# Altium project integrating_box_light_source.PrjPcb
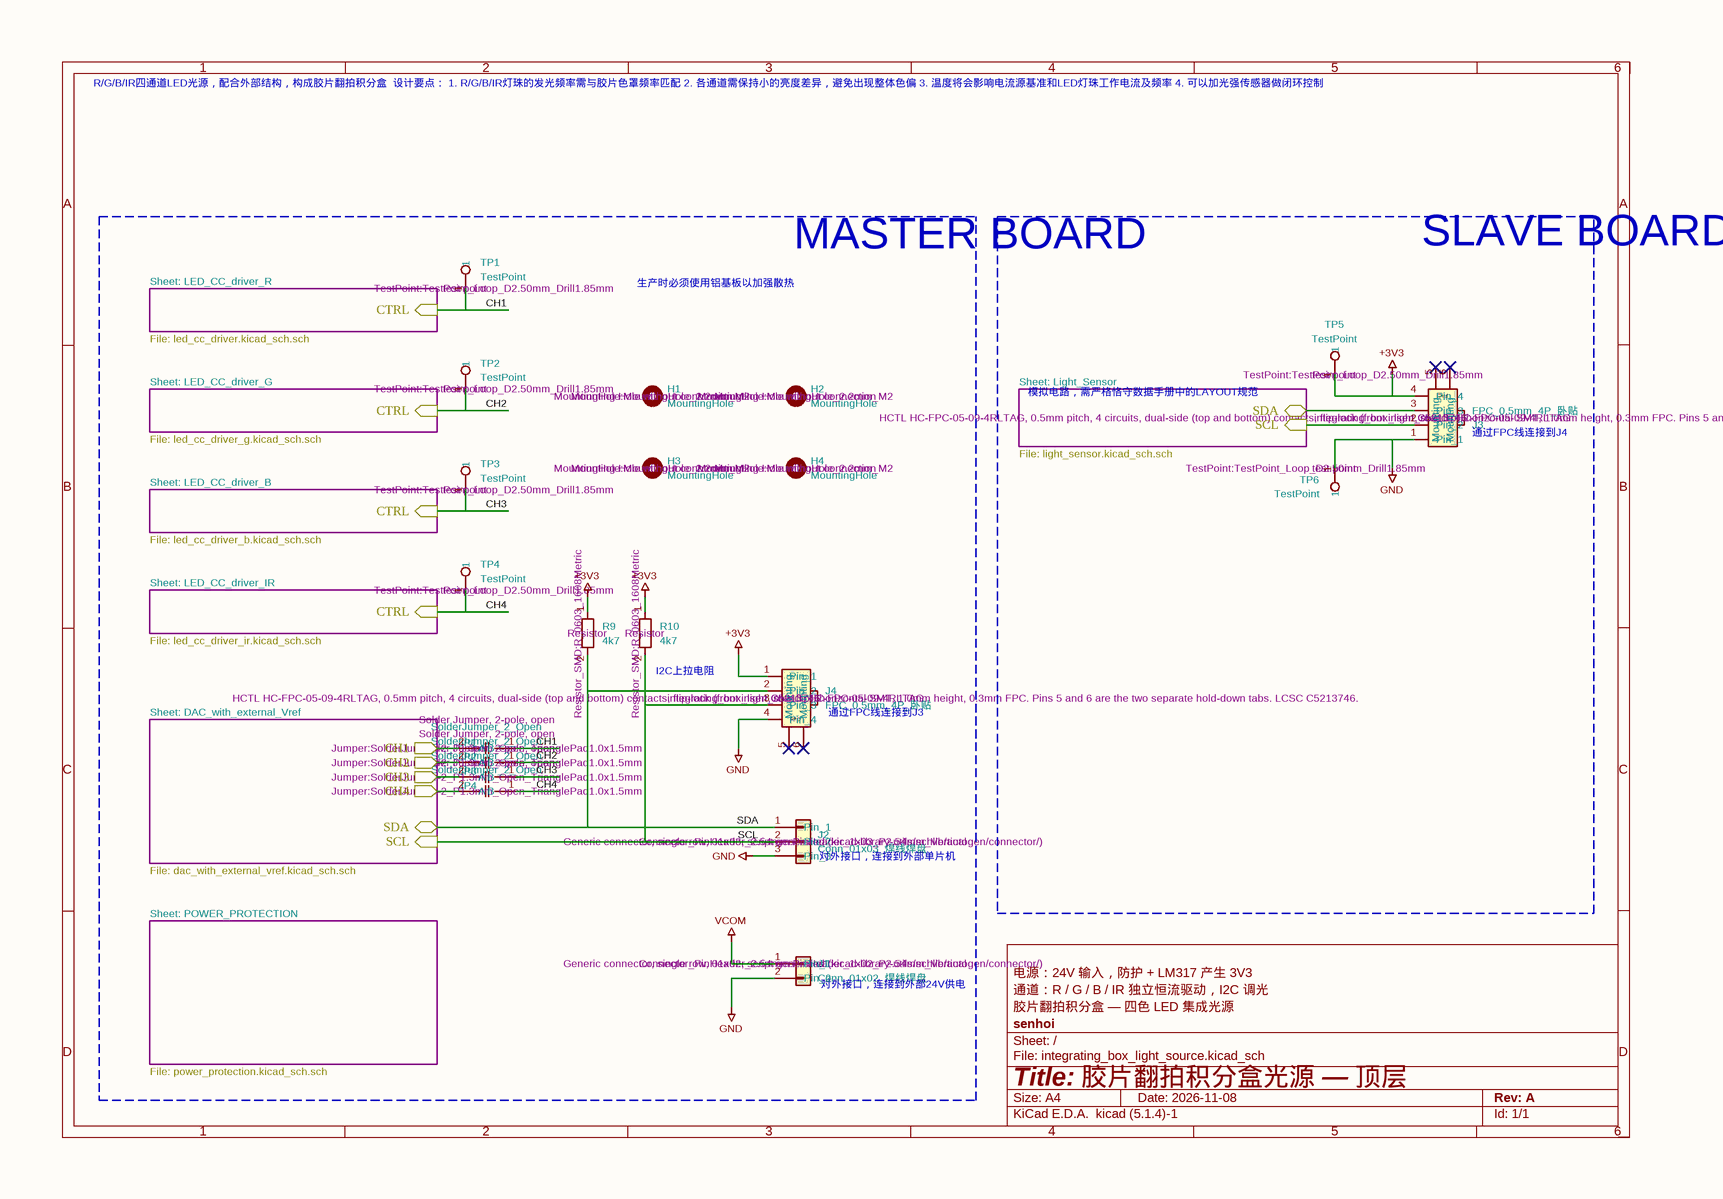
[diagram p0: integrating_box_light_source.SchDoc]
8 sheets, 81 parts. Net scope: hierarchical (ports join the sheet entries above them; power ports are global).
Board file: integrating_box_light_source.PcbDoc
Sheets:
  integrating_box_light_source.SchDoc
    LED_CC_driver_B = led_cc_driver_b.SchDoc
    DAC_with_external_Vref = dac_with_external_vref.SchDoc
    POWER_PROTECTION = power_protection.SchDoc
    Light_Sensor = light_sensor.SchDoc
    LED_CC_driver_G = led_cc_driver_g.SchDoc
    LED_CC_driver_IR = led_cc_driver_ir.SchDoc
    LED_CC_driver_R = led_cc_driver.SchDoc

## Sheet integrating_box_light_source.SchDoc
size 297 x 209 mm

### Parts
H1  Description: Mounting Hole without connection  Footprint: MountingHole:MountingHole_2.2mm_M2  [MountingHole_2.2mm_M2]  (hidden comment: MountingHole)
H2  Description: Mounting Hole without connection  Footprint: MountingHole:MountingHole_2.2mm_M2  [MountingHole_2.2mm_M2]  (hidden comment: MountingHole)
H3  Description: Mounting Hole without connection  Footprint: MountingHole:MountingHole_2.2mm_M2  [MountingHole_2.2mm_M2]  (hidden comment: MountingHole)
H4  Description: Mounting Hole without connection  Footprint: MountingHole:MountingHole_2.2mm_M2  [MountingHole_2.2mm_M2]  (hidden comment: MountingHole)
J1  Description: Generic connector, single row, 01x02, script generated (kicad-library-utils/schlib/autogen/connector/)  Footprint: Connector_PinHeader_2.54mm:PinHeader_1x02_P2.54mm_Vertical  [PinHeader_1x02_P2.54mm_Vertical]  (hidden comment: Conn_01x02_焊线焊盘)
J2  Description: Generic connector, single row, 01x03, script generated (kicad-library-utils/schlib/autogen/connector/)  Footprint: Connector_PinHeader_2.54mm:PinHeader_1x03_P2.54mm_Vertical  [PinHeader_1x03_P2.54mm_Vertical]  (hidden comment: Conn_01x03_焊线焊盘)
J3  Description: HCTL HC-FPC-05-09-4RLTAG, 0.5mm pitch, 4 circuits, dual-side (top and bottom) contacts, flip-lock (front insert, rear flip), horizontal SMT, 1.0mm height, 0.3mm FPC. Pins 5 and 6 are the two separate hold-down tabs. LCSC C5213746.  LCSC: C5213746  Footprint: integrating_box_light_source:HC-FPC-05-09-4RLTAG  [HC-FPC-05-09-4RLTAG]  (hidden comment: FPC_0.5mm_4P_卧贴)
J4  Description: HCTL HC-FPC-05-09-4RLTAG, 0.5mm pitch, 4 circuits, dual-side (top and bottom) contacts, flip-lock (front insert, rear flip), horizontal SMT, 1.0mm height, 0.3mm FPC. Pins 5 and 6 are the two separate hold-down tabs. LCSC C5213746.  LCSC: C5213746  Footprint: integrating_box_light_source:HC-FPC-05-09-4RLTAG  [HC-FPC-05-09-4RLTAG]  (hidden comment: FPC_0.5mm_4P_卧贴)
JP1  Description: Solder Jumper, 2-pole, open  Footprint: Jumper:SolderJumper-2_P1.3mm_Open_TrianglePad1.0x1.5mm  [SolderJumper-2_P1.3mm_Open_TrianglePad1.0x1.5mm]  (hidden comment: SolderJumper_2_Open)
JP2  Description: Solder Jumper, 2-pole, open  Footprint: Jumper:SolderJumper-2_P1.3mm_Open_TrianglePad1.0x1.5mm  [SolderJumper-2_P1.3mm_Open_TrianglePad1.0x1.5mm]  (hidden comment: SolderJumper_2_Open)
JP3  Description: Solder Jumper, 2-pole, open  Footprint: Jumper:SolderJumper-2_P1.3mm_Open_TrianglePad1.0x1.5mm  [SolderJumper-2_P1.3mm_Open_TrianglePad1.0x1.5mm]  (hidden comment: SolderJumper_2_Open)
JP4  Description: Solder Jumper, 2-pole, open  Footprint: Jumper:SolderJumper-2_P1.3mm_Open_TrianglePad1.0x1.5mm  [SolderJumper-2_P1.3mm_Open_TrianglePad1.0x1.5mm]  (hidden comment: SolderJumper_2_Open)
R9  Description: Resistor  Footprint: Resistor_SMD:R_0603_1608Metric  [R_0603_1608Metric]  (hidden comment: 4k7)
R10  Description: Resistor  Footprint: Resistor_SMD:R_0603_1608Metric  [R_0603_1608Metric]  (hidden comment: 4k7)
TP1  Description: test point  Footprint: TestPoint:TestPoint_Loop_D2.50mm_Drill1.85mm  [TestPoint_Loop_D2.50mm_Drill1.85mm]  (hidden comment: TestPoint)
TP2  Description: test point  Footprint: TestPoint:TestPoint_Loop_D2.50mm_Drill1.85mm  [TestPoint_Loop_D2.50mm_Drill1.85mm]  (hidden comment: TestPoint)
TP3  Description: test point  Footprint: TestPoint:TestPoint_Loop_D2.50mm_Drill1.85mm  [TestPoint_Loop_D2.50mm_Drill1.85mm]  (hidden comment: TestPoint)
TP4  Description: test point  Footprint: TestPoint:TestPoint_Loop_D2.50mm_Drill1.85mm  [TestPoint_Loop_D2.50mm_Drill1.85mm]  (hidden comment: TestPoint)
TP5  Description: test point  Footprint: TestPoint:TestPoint_Loop_D2.50mm_Drill1.85mm  [TestPoint_Loop_D2.50mm_Drill1.85mm]  (hidden comment: TestPoint)
TP6  Description: test point  Footprint: TestPoint:TestPoint_Loop_D2.50mm_Drill1.85mm  [TestPoint_Loop_D2.50mm_Drill1.85mm]  (hidden comment: TestPoint)

### Blocks framed on the sheet
MASTER BOARD: H1-H4 J1 J2 J4 JP1-JP4 R9 R10 TP1-TP4
SLAVE BOARD: J3 TP5 TP6

### Sub-sheets
DAC_with_external_Vref = dac_with_external_vref.SchDoc: CH1 (out), CH2 (out), CH3 (out), CH4 (out), SCL (in), SDA (bidir)
LED_CC_driver_B = led_cc_driver_b.SchDoc: CTRL (in)
LED_CC_driver_G = led_cc_driver_g.SchDoc: CTRL (in)
LED_CC_driver_IR = led_cc_driver_ir.SchDoc: CTRL (in)
LED_CC_driver_R = led_cc_driver.SchDoc: CTRL (in)
Light_Sensor = light_sensor.SchDoc: SDA (bidir), SCL (in)
POWER_PROTECTION = power_protection.SchDoc: no entries

### Nets
+3V3: J3.4(Pin_4) J4.1(Pin_1) R9.1 R10.1 TP5.1
GND: J1.2(Pin_2) J2.3(Pin_3) J3.1(Pin_1) J4.4(Pin_4) TP6.1
VCOM: J1.1(Pin_1)
CH1: JP1.1(A) TP1.1 ; sheet LED_CC_driver_R/CTRL
CH1: JP1.2(B) ; sheet DAC_with_external_Vref/CH1  [a separate net that carries the same name]
CH2: JP2.1(A) TP2.1 ; sheet LED_CC_driver_G/CTRL
CH2: JP2.2(B) ; sheet DAC_with_external_Vref/CH2  [a separate net that carries the same name]
CH3: JP3.1(A) TP3.1 ; sheet LED_CC_driver_B/CTRL
CH3: JP3.2(B) ; sheet DAC_with_external_Vref/CH3  [a separate net that carries the same name]
CH4: JP4.1(A) TP4.1 ; sheet LED_CC_driver_IR/CTRL
CH4: JP4.2(B) ; sheet DAC_with_external_Vref/CH4  [a separate net that carries the same name]
SCL: J2.2(Pin_2) J4.3(Pin_3) R10.2 ; sheet DAC_with_external_Vref/SCL
SCL: J3.2(Pin_2) ; sheet Light_Sensor/SCL  [a separate net that carries the same name]
SDA: J2.1(Pin_1) J4.2(Pin_2) R9.2 ; sheet DAC_with_external_Vref/SDA
SDA: J3.3(Pin_3) ; sheet Light_Sensor/SDA  [a separate net that carries the same name]

Not connected (* = marked no-connect by the designer): J3 5(Mounting)* 6(Mounting)*; J4 5(Mounting)* 6(Mounting)*

### Notes on the sheet
- R/G/B/IR四通道LED光源，配合外部结构，构成胶片翻拍积分盒
  设计要点：
  1. R/G/B/IR灯珠的发光频率需与胶片色罩频率匹配
  2. 各通道需保持小的亮度差异，避免出现整体色偏
  3. 温度将会影响电流源基准和LED灯珠工作电流及频率
  4. 可以加光强传感器做闭环控制
- Sheet: LED_CC_driver_R
- 生产时必须使用铝基板以加强散热
- File: led_cc_driver.kicad_sch.sch
- File: led_cc_driver_g.kicad_sch.sch
- Sheet: LED_CC_driver_G
- Sheet: Light_Sensor
- 模拟电路，需严格恪守数据手册中的LAYOUT规范
- Sheet: LED_CC_driver_B
- File: light_sensor.kicad_sch.sch
- (near J3) 通过FPC线连接到J4
- File: led_cc_driver_b.kicad_sch.sch
- File: led_cc_driver_ir.kicad_sch.sch
- Sheet: LED_CC_driver_IR
- Sheet: DAC_with_external_Vref
- (near R10) I2C上拉电阻
- (near J4) 通过FPC线连接到J3
- File: dac_with_external_vref.kicad_sch.sch
- (near J2) 对外接口，连接到外部单片机
- Sheet: POWER_PROTECTION
- (near J1) 对外接口，连接到外部24V供电
- File: power_protection.kicad_sch.sch
- 1
- 2
- 3
- 4
- 5
- 6
- A
- B
- C
- 胶片翻拍积分盒 — 四色 LED 集成光源
- 通道：R / G / B / IR 独立恒流驱动，I2C 调光
- 电源：24V 输入，防护 + LM317 产生 3V3
- D
- Title: 胶片翻拍积分盒光源 — 顶层
- File: integrating_box_light_source.kicad_sch
- Sheet: /
- senhoi
- KiCad E.D.A.  kicad (5.1.4)-1
- Size: A4
- Date: 2026-11-08
- Rev: A
- Id: 1/1
- (in symbol HC-FPC-05-09-4RLTAG) FPC

### Library data of the parts
J1 = Conn_01x02: Value: Conn_01x02_焊线焊盘
J2 = Conn_01x03: Value: Conn_01x03_焊线焊盘
J3 J4 = HC-FPC-05-09-4RLTAG: LCSC Part: C5213746; Value: FPC_0.5mm_4P_卧贴
R9 R10 = R: Value: 4k7
H1-H4 = MountingHole: Value: MountingHole
JP1-JP4 = SolderJumper_2_Open: Value: SolderJumper_2_Open
TP1-TP6 = TestPoint: Value: TestPoint

## Sheet led_cc_driver_b.SchDoc
size 297 x 209 mm
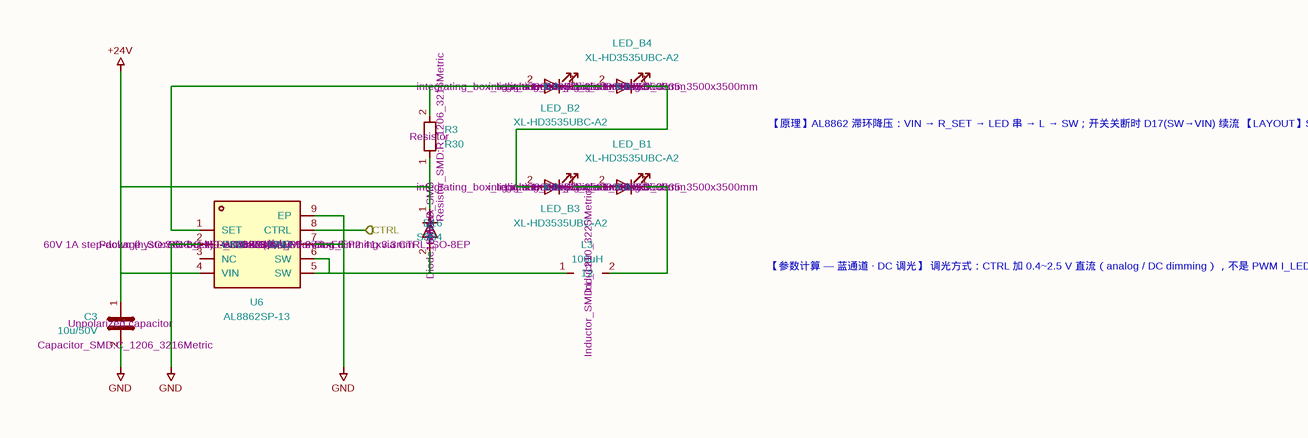
[diagram p1: led_cc_driver_b.SchDoc]

### Parts
C3  Description: Unpolarized capacitor  Footprint: Capacitor_SMD:C_1206_3216Metric  [C_1206_3216Metric]  (hidden comment: 10u/50V)
D16  Description: Diode  Sim.Pins: 1=K 2=A  Footprint: Diode_SMD:D_SMB  [D_SMB]  (hidden comment: SS34)
L3  Description: Inductor  Footprint: Inductor_SMD:L_1210_3225Metric  [L_1210_3225Metric]  (hidden comment: 100uH)
LED_B1  Description: Light emitting diode  Sim.Pins: 1=K 2=A  LCSC Part: C3646953  Footprint: integrating_box_light_source:LED_3535_3500x3500mm  [LED_3535_3500x3500mm]  (hidden comment: XL-HD3535UBC-A2)
LED_B2  Description: Light emitting diode  Sim.Pins: 1=K 2=A  LCSC Part: C3646953  Footprint: integrating_box_light_source:LED_3535_3500x3500mm  [LED_3535_3500x3500mm]  (hidden comment: XL-HD3535UBC-A2)
LED_B3  Description: Light emitting diode  Sim.Pins: 1=K 2=A  LCSC Part: C3646953  Footprint: integrating_box_light_source:LED_3535_3500x3500mm  [LED_3535_3500x3500mm]  (hidden comment: XL-HD3535UBC-A2)
LED_B4  Description: Light emitting diode  Sim.Pins: 1=K 2=A  LCSC Part: C3646953  Footprint: integrating_box_light_source:LED_3535_3500x3500mm  [LED_3535_3500x3500mm]  (hidden comment: XL-HD3535UBC-A2)
R3  Description: Resistor  Footprint: Resistor_SMD:R_1206_3216Metric  [R_1206_3216Metric]  (hidden comment: R30)
U6  Description: 60V 1A step-down (hysteretic buck) LED driver, PWM/analog dimming via CTRL, SO-8EP  LCSC Part: C526360  Manufacturer: DIODES(美台)  Package: SO-8_L4.9-W3.9-P1.27-LS6.0-BL-EP  Footprint: Package_SO:SOIC-8-1EP_3.9x4.9mm_P1.27mm_EP2.41x3.3mm  [SOIC-8-1EP_3.9x4.9mm_P1.27mm_EP2.41x3.3mm]  (hidden comment: AL8862SP-13)

### Ports
CTRL (in)

### Nets
+24V: C3.1 D16.1(K) R3.1 U6.4(VIN)
GND: C3.2 U6.2(GND) U6.7(GND) U6.9(EP)
CH3: U6.8(CTRL) ; port CTRL
NetD16_2: D16.2(A) L3.1 U6.5(SW) U6.6(SW)
NetL3_2: L3.2 LED_B1.1(K)
NetLED_B1_2: LED_B1.2(A) LED_B3.1(K)
NetLED_B2_1: LED_B2.1(K) LED_B4.2(A)
NetLED_B2_2: LED_B2.2(A) R3.2 U6.1(SET)
NetLED_B3_2: LED_B3.2(A) LED_B4.1(K)

Not connected (* = marked no-connect by the designer): U6 3(NC)

### Notes on the sheet
- 【原理】AL8862 滞环降压：VIN → R_SET → LED 串 → L → SW；开关关断时 D17(SW→VIN) 续流
  【LAYOUT】SW→L/D 走线最短以降低 EMI；EP 大面积铺铜 + 散热过孔；R_SET 与 VIN/SET 用 Kelvin 接法
  【焊接】3535 灯珠回流焊 240±5℃/6s，只建议返修时手工焊（<300℃/3s）
- 【参数计算 — 蓝通道 · DC 调光】
  调光方式：CTRL 加 0.4~2.5 V 直流（analog / DC dimming），不是 PWM
  I_LED(100%) = 0.1/0.30 = 333 mA；ΔI = 26 mV/R_SET = 86.6 mA（VSET_HYS = ±13%，固定值）
  V_LED = 4×3.4 V = 13.6 V（蓝光 Vf 最高，留给恒流源余量最小）
  t_OFF = 100µ×86.6m/(13.6+0.5+0.13) = 610 ns
  t_ON = 8.66µ/(24−13.6−0.13) = 845 ns → f_SW = 687 kHz（满载 CCM）
  占空比 D = 13.6/24 = 0.57（四路最高）；母线降到 20 V 仍可调满
  调暗时纹波不降（ΔI 固定）→ 低亮段进 DCM，频率下降
- 1
- 2
- 3
- 4
- 5
- 6
- A
- B
- C
- 通道：蓝光 465nm / 4 颗 3535 串联
- IC：AL8862SP-13 (LCSC C526360)
- 灯珠：XL-HD3535UBC-A2 (LCSC C3646953)
- D
- Title: LED 恒流驱动 — 蓝光通道
- File: led_cc_driver_b.kicad_sch
- Sheet: /
- integrating_box_light_source
- KiCad E.D.A.  kicad (5.1.4)-1
- Size: A4
- Date: 2026-11-08
- Rev: A
- Id: 1/1

### Library data of the parts
C3 = C: Value: 10u/50V
D16 = D: Sim.Device: D; Value: SS34
L3 = L: Value: 100uH
LED_B1-LED_B4 = LED: Value: XL-HD3535UBC-A2
R3 = R: Value: R30
U6 = AL8862SP-13: MPN: AL8862SP-13; Value: AL8862SP-13

## Sheet dac_with_external_vref.SchDoc
size 297 x 209 mm
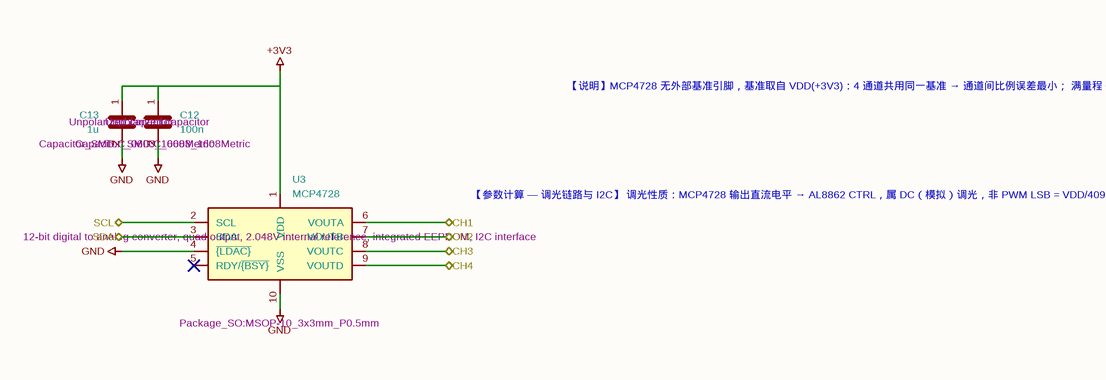
[diagram p2: dac_with_external_vref.SchDoc]

### Parts
C12  Description: Unpolarized capacitor  Footprint: Capacitor_SMD:C_0603_1608Metric  [C_0603_1608Metric]  (hidden comment: 100n)
C13  Description: Unpolarized capacitor  Footprint: Capacitor_SMD:C_0603_1608Metric  [C_0603_1608Metric]  (hidden comment: 1u)
U3  Description: 12-bit digital to analog converter, quad output, 2.048V internal reference, integrated EEPROM, I2C interface  Footprint: Package_SO:MSOP-10_3x3mm_P0.5mm  [MSOP-10_3x3mm_P0.5mm]  (hidden comment: MCP4728)

### Ports
CH1 (bidir), CH2 (bidir), CH3 (bidir), CH4 (bidir), SCL (bidir), SDA (bidir)

### Nets
+3V3: C12.1 C13.1 U3.1(VDD)
GND: C12.2 C13.2 U3.4(~{{LDAC}}) U3.10(VSS)
CH1: U3.6(VOUTA) ; port CH1
CH2: U3.7(VOUTB) ; port CH2
CH3: U3.8(VOUTC) ; port CH3
CH4: U3.9(VOUTD) ; port CH4
SCL: U3.2(SCL) ; port SCL
SDA: U3.3(SDA) ; port SDA

Not connected (* = marked no-connect by the designer): U3 5(RDY/~{{BSY}})*

### Notes on the sheet
- 【说明】MCP4728 无外部基准引脚，基准取自 VDD(+3V3)：4 通道共用同一基准 → 通道间比例误差最小；
  满量程 0~3.3 V，覆盖 AL8862 CTRL 的 0.4~2.5 V 全调光段。（若必须外部基准，可改 DAC7574）
  【LAYOUT】VDD 的 100nF 紧靠引脚 1 并直接回地；I2C 短且远离 SW 节点；四路 VOUT 等长同层，避免与 SW 平行
- 【参数计算 — 调光链路与 I2C】
  调光性质：MCP4728 输出直流电平 → AL8862 CTRL，属 DC（模拟）调光，非 PWM
  LSB = VDD/4096 = 3.3/4096 = 0.806 mV
  CTRL 0.4 V→10%、2.5 V→100% ⇒ 代码 497→3102（2605 级覆盖 10~100%，约 0.035%/级）
  （对照：PWM 调光需 CTRL 在 <0.3 V 与 >2.6 V 间切换，本设计不用）
  I2C 上拉：Rp,max = tr/(0.847·Cb)；400 kHz 时 tr ≤ 300 ns，板内 Cb≈50 pF ⇒ Rp ≤ 7 kΩ
  现用 4k7 → tr = 0.847×4.7k×50p = 199 ns ✔（外接排线 Cb>75 pF 时需降到 3.3k 以下）
- 1
- 2
- 3
- 4
- 5
- 6
- A
- B
- C
- DAC：MCP4728（I2C，4×12 位，LCSC 待选）
- 基准：内部 VDD 基准（MCP4728 无外部基准引脚）
- 输出：CH1~CH4 → AL8862 CTRL 调光
- D
- Title: I2C 四通道 DAC — MCP4728
- File: dac_with_external_vref.kicad_sch
- Sheet: /
- integrating_box_light_source
- KiCad E.D.A.  kicad (5.1.4)-1
- Size: A4
- Date: 2026-11-08
- Rev: A
- Id: 1/1

### Library data of the parts
C12 C13 = C
  C12: Value: 100n
  C13: Value: 1u
U3 = MCP4728: Value: MCP4728

## Sheet power_protection.SchDoc
size 297 x 209 mm
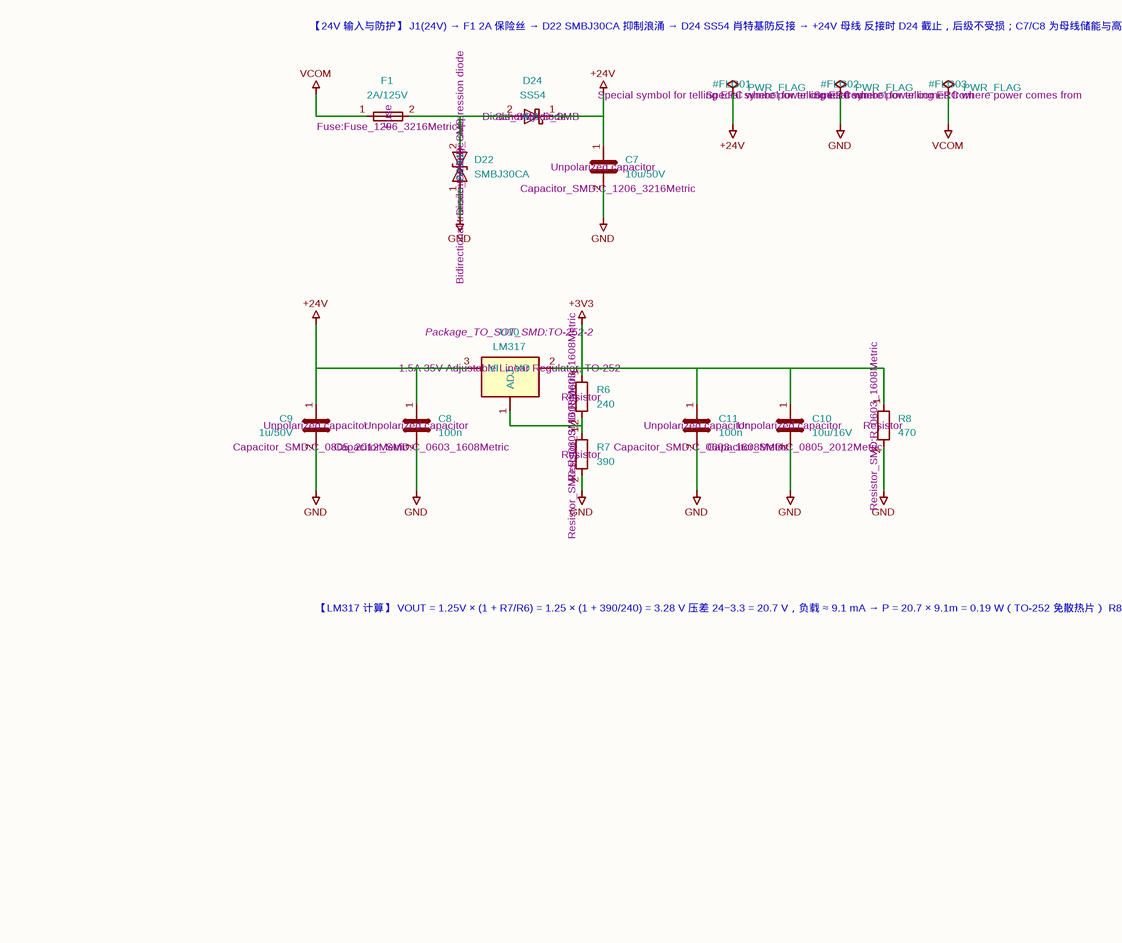
[diagram p3: power_protection.SchDoc]

### Parts
#FLG01  Description: Special symbol for telling ERC where power comes from  (hidden comment: PWR_FLAG)  (graphical)
#FLG02  Description: Special symbol for telling ERC where power comes from  (hidden comment: PWR_FLAG)  (graphical)
#FLG03  Description: Special symbol for telling ERC where power comes from  (hidden comment: PWR_FLAG)  (graphical)
C7  Description: Unpolarized capacitor  Footprint: Capacitor_SMD:C_1206_3216Metric  [C_1206_3216Metric]  (hidden comment: 10u/50V)
C8  Description: Unpolarized capacitor  Footprint: Capacitor_SMD:C_0603_1608Metric  [C_0603_1608Metric]  (hidden comment: 100n)
C9  Description: Unpolarized capacitor  Footprint: Capacitor_SMD:C_0805_2012Metric  [C_0805_2012Metric]  (hidden comment: 1u/50V)
C10  Description: Unpolarized capacitor  Footprint: Capacitor_SMD:C_0805_2012Metric  [C_0805_2012Metric]  (hidden comment: 10u/16V)
C11  Description: Unpolarized capacitor  Footprint: Capacitor_SMD:C_0603_1608Metric  [C_0603_1608Metric]  (hidden comment: 100n)
D22  Description: Bidirectional transient-voltage-suppression diode  Footprint: Diode_SMD:D_SMB  [D_SMB]  (hidden comment: SMBJ30CA)
D24  Description: Schottky diode  Footprint: Diode_SMD:D_SMB  [D_SMB]  (hidden comment: SS54)
F1  Footprint: Fuse:Fuse_1206_3216Metric  [Fuse_1206_3216Metric]  (hidden comment: 2A/125V)
R6  Description: Resistor  Footprint: Resistor_SMD:R_0603_1608Metric  [R_0603_1608Metric]  (hidden comment: 240)
R7  Description: Resistor  Footprint: Resistor_SMD:R_0603_1608Metric  [R_0603_1608Metric]  (hidden comment: 390)
R8  Description: Resistor  Footprint: Resistor_SMD:R_0603_1608Metric  [R_0603_1608Metric]  (hidden comment: 470)
U10  Description: 1.5A 35V Adjustable Linear Regulator, TO-252  Footprint: Package_TO_SOT_SMD:TO-252-2  [TO-252-2]  (hidden comment: LM317)

### Nets
+3V3: C10.1 C11.1 R6.1 R8.1 U10.2(VO)
+24V: #FLG01.1 C7.1 C8.1 C9.1 D24.1(K) U10.3(VI)
GND: #FLG02.1 C7.2 C8.2 C9.2 C10.2 C11.2 D22.1(A1) R7.2 R8.2
VCOM: #FLG03.1 F1.1
NetD22_2: D22.2(A2) D24.2(A) F1.2
NetR6_2: R6.2 R7.1 U10.1(ADJ)

### Notes on the sheet
- 【24V 输入与防护】
  J1(24V) → F1 2A 保险丝 → D22 SMBJ30CA 抑制浪涌 → D24 SS54 肖特基防反接 → +24V 母线
  反接时 D24 截止，后级不受损；C7/C8 为母线储能与高频旁路
  保险丝：4×333 mA = 1.33 A ⇒ 2A；TVS：SMBJ30CA 关断 30 V > 24×1.1 = 26.4 V，峰值钳位 48.4 V
- 【LM317 计算】
  VOUT = 1.25V × (1 + R7/R6) = 1.25 × (1 + 390/240) = 3.28 V
  压差 24−3.3 = 20.7 V，负载 ≈ 9.1 mA → P = 20.7 × 9.1m = 0.19 W（TO-252 免散热片）
  R8 = 470Ω 预负载（7 mA），保证 LM317 轻载稳压；C9 输处、C10/C11 输出
- 1
- 2
- 3
- 4
- 5
- 6
- A
- B
- C
- 输入：24V DC（2A 保险丝 + SMBJ30CA + SS54 防反接）
- 3V3：LM317 线性稳压（模拟电源用线性，避免开关噪声进入 DAC/ADC）
- D
- Title: 电源与防护 — 24V 输入 / 3V3
- File: power_protection.kicad_sch
- Sheet: /
- integrating_box_light_source
- KiCad E.D.A.  kicad (5.1.4)-1
- Size: A4
- Date: 2026-11-08
- Rev: A
- Id: 1/1

### Library data of the parts
C7-C11 = C
  C7: Value: 10u/50V
  C8 C11: Value: 100n
  C9: Value: 1u/50V
  C10: Value: 10u/16V
D22 = D_TVS: Value: SMBJ30CA
D24 = D_Schottky: Value: SS54
F1 = Fuse: Description: Fuse; Value: 2A/125V
R6-R8 = R
  R6: Value: 240
  R7: Value: 390
  R8: Value: 470
U10 = LM317_TO-252: Value: LM317
#FLG01 #FLG02 #FLG03 = PWR_FLAG: Value: PWR_FLAG

## Sheet light_sensor.SchDoc
size 297 x 209 mm
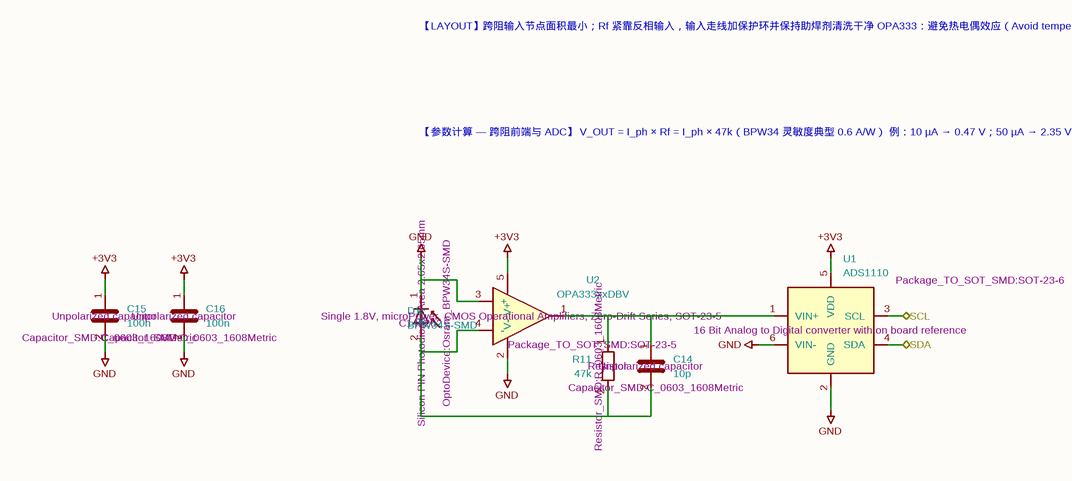
[diagram p4: light_sensor.SchDoc]

### Parts
C14  Description: Unpolarized capacitor  Footprint: Capacitor_SMD:C_0603_1608Metric  [C_0603_1608Metric]  (hidden comment: 10p)
C15  Description: Unpolarized capacitor  Footprint: Capacitor_SMD:C_0603_1608Metric  [C_0603_1608Metric]  (hidden comment: 100n)
C16  Description: Unpolarized capacitor  Footprint: Capacitor_SMD:C_0603_1608Metric  [C_0603_1608Metric]  (hidden comment: 100n)
D1  Description: Silicon PIN Photodiode, Area 2.65x2.65mm  LCSC Part: C145262  Footprint: OptoDevice:Osram_BPW34S-SMD  [Osram_BPW34S-SMD]  (hidden comment: BPW34S-SMD)
R11  Description: Resistor  Footprint: Resistor_SMD:R_0603_1608Metric  [R_0603_1608Metric]  (hidden comment: 47k)
U1  Description: 16 Bit Analog to Digital converter with on board reference  Footprint: Package_TO_SOT_SMD:SOT-23-6  [SOT-23-6]  (hidden comment: ADS1110)
U2  Description: Single 1.8V, microPower, CMOS Operational Amplifiers, Zero-Drift Series, SOT-23-5  Footprint: Package_TO_SOT_SMD:SOT-23-5  [SOT-23-5]  (hidden comment: OPA333xxDBV)

### Ports
SCL (bidir), SDA (bidir)

### Nets
+3V3: C15.1 C16.1 U1.5(VDD) U2.5(V+)
GND: C15.2 C16.2 D1.1(K) U1.2(GND) U1.6(VIN-) U2.2(V-) U2.3(+)
SCL: U1.3(SCL) ; port SCL
SDA: U1.4(SDA) ; port SDA
NetC14_1: C14.1 R11.1 U1.1(VIN+) U2.1
NetC14_2: C14.2 D1.2(A) R11.2 U2.4(-)

### Notes on the sheet
- 【LAYOUT】跨阻输入节点面积最小；Rf 紧靠反相输入，输入走线加保护环并保持助焊剂清洗干净
  OPA333：避免热电偶效应（Avoid temperature gradients that create thermoelectric (Seebeck) effects）
  ——远离热源、避免异种金属结点、防止气流直吹
  ADS1110：差分输入成对走线、远离 SW 节点与电感；VDD 的 100nF 就近回地
- 【参数计算 — 跨阻前端与 ADC】
  V_OUT = I_ph × Rf = I_ph × 47k（BPW34 灵敏度典型 0.6 A/W）
  例：10 µA → 0.47 V；50 µA → 2.35 V（ADS1110 满量程 ±2.048 V @PGA=1）
  带宽 f_p = 1/(2π·Rf·Cf) = 1/(2π×47k×10p) = 339 kHz（Cf 兼作相位补偿）
  噪声：√(4kTRf) = 28 nV/√Hz，折合总噪声 ≈ 20 µV rms（约 0.3 LSB）
  ADC 分辨率：LSB = 4.096/65536 = 62.5 µV ⇒ 电流分辨率 62.5µ/47k = 1.33 nA
- 1
- 2
- 3
- 4
- 5
- 6
- A
- B
- C
- 光电：BPW34（光伏模式）+ OPA333 跨阻
- ADC：ADS1110 16 位差分，内部 2.048V 基准
- 增益：Rf = 47k，Cf = 10p
- D
- Title: 光强检测 — BPW34 跨阻 + ADS1110
- File: light_sensor.kicad_sch
- Sheet: /
- integrating_box_light_source
- KiCad E.D.A.  kicad (5.1.4)-1
- Size: A4
- Date: 2026-11-08
- Rev: A
- Id: 1/1

### Library data of the parts
C14-C16 = C
  C14: Value: 10p
  C15 C16: Value: 100n
D1 = BPW34-SMD: Value: BPW34S-SMD
R11 = R: Value: 47k
U1 = ADS1110: Value: ADS1110
U2 = OPA333xxDBV: Value: OPA333xxDBV

## Sheet led_cc_driver_g.SchDoc
size 297 x 209 mm
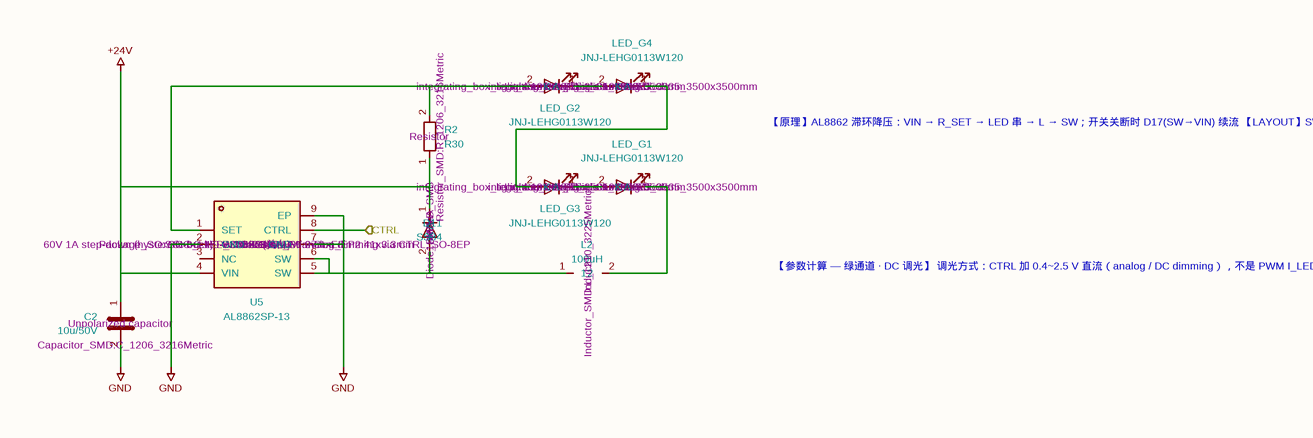
[diagram p5: led_cc_driver_g.SchDoc]

### Parts
C2  Description: Unpolarized capacitor  Footprint: Capacitor_SMD:C_1206_3216Metric  [C_1206_3216Metric]  (hidden comment: 10u/50V)
D11  Description: Diode  Sim.Pins: 1=K 2=A  Footprint: Diode_SMD:D_SMB  [D_SMB]  (hidden comment: SS34)
L2  Description: Inductor  Footprint: Inductor_SMD:L_1210_3225Metric  [L_1210_3225Metric]  (hidden comment: 100uH)
LED_G1  Description: Light emitting diode  Sim.Pins: 1=K 2=A  LCSC Part: C19185875  Footprint: integrating_box_light_source:LED_3535_3500x3500mm  [LED_3535_3500x3500mm]  (hidden comment: JNJ-LEHG0113W120)
LED_G2  Description: Light emitting diode  Sim.Pins: 1=K 2=A  LCSC Part: C19185875  Footprint: integrating_box_light_source:LED_3535_3500x3500mm  [LED_3535_3500x3500mm]  (hidden comment: JNJ-LEHG0113W120)
LED_G3  Description: Light emitting diode  Sim.Pins: 1=K 2=A  LCSC Part: C19185875  Footprint: integrating_box_light_source:LED_3535_3500x3500mm  [LED_3535_3500x3500mm]  (hidden comment: JNJ-LEHG0113W120)
LED_G4  Description: Light emitting diode  Sim.Pins: 1=K 2=A  LCSC Part: C19185875  Footprint: integrating_box_light_source:LED_3535_3500x3500mm  [LED_3535_3500x3500mm]  (hidden comment: JNJ-LEHG0113W120)
R2  Description: Resistor  Footprint: Resistor_SMD:R_1206_3216Metric  [R_1206_3216Metric]  (hidden comment: R30)
U5  Description: 60V 1A step-down (hysteretic buck) LED driver, PWM/analog dimming via CTRL, SO-8EP  LCSC Part: C526360  Manufacturer: DIODES(美台)  Package: SO-8_L4.9-W3.9-P1.27-LS6.0-BL-EP  Footprint: Package_SO:SOIC-8-1EP_3.9x4.9mm_P1.27mm_EP2.41x3.3mm  [SOIC-8-1EP_3.9x4.9mm_P1.27mm_EP2.41x3.3mm]  (hidden comment: AL8862SP-13)

### Ports
CTRL (in)

### Nets
+24V: C2.1 D11.1(K) R2.1 U5.4(VIN)
GND: C2.2 U5.2(GND) U5.7(GND) U5.9(EP)
CH2: U5.8(CTRL) ; port CTRL
NetD11_2: D11.2(A) L2.1 U5.5(SW) U5.6(SW)
NetL2_2: L2.2 LED_G1.1(K)
NetLED_G1_2: LED_G1.2(A) LED_G3.1(K)
NetLED_G2_1: LED_G2.1(K) LED_G4.2(A)
NetLED_G2_2: LED_G2.2(A) R2.2 U5.1(SET)
NetLED_G3_2: LED_G3.2(A) LED_G4.1(K)

Not connected (* = marked no-connect by the designer): U5 3(NC)

### Notes on the sheet
- 【原理】AL8862 滞环降压：VIN → R_SET → LED 串 → L → SW；开关关断时 D17(SW→VIN) 续流
  【LAYOUT】SW→L/D 走线最短以降低 EMI；EP 大面积铺铜 + 散热过孔；R_SET 与 VIN/SET 用 Kelvin 接法
  【焊接】3535 灯珠回流焊 240±5℃/6s，只建议返修时手工焊（<300℃/3s）
- 【参数计算 — 绿通道 · DC 调光】
  调光方式：CTRL 加 0.4~2.5 V 直流（analog / DC dimming），不是 PWM
  I_LED(100%) = 0.1/0.30 = 333 mA；ΔI = 26 mV/R_SET = 86.6 mA（VSET_HYS = ±13%，固定值）
  V_LED = 4×3.2 V = 12.8 V（Vf 2.8~3.5 V，取典型 3.2）
  t_OFF = 100µ×86.6m/(12.8+0.5+0.13) = 650 ns
  t_ON = 8.66µ/(24−12.8−0.13) = 783 ns → f_SW = 698 kHz（满载 CCM）
  调暗到 10%：纹波仍 ~86.6 mA > 平均 33 mA → 进 DCM，频率下降（与手册“负载范围内校核 on/off 时间”一致）
  P_R_SET = 0.033 W；单颗灯珠约 1.1 W，焊盘铺铜按 3535 规格书
- 1
- 2
- 3
- 4
- 5
- 6
- A
- B
- C
- 通道：绿光 525nm / 4 颗 3535 串联
- IC：AL8862SP-13 (LCSC C526360)
- 灯珠：JNJ-LEHG0113W120 (LCSC C19185875)
- D
- Title: LED 恒流驱动 — 绿光通道
- File: led_cc_driver_g.kicad_sch
- Sheet: /
- integrating_box_light_source
- KiCad E.D.A.  kicad (5.1.4)-1
- Size: A4
- Date: 2026-11-08
- Rev: A
- Id: 1/1

### Library data of the parts
C2 = C: Value: 10u/50V
D11 = D: Sim.Device: D; Value: SS34
L2 = L: Value: 100uH
LED_G1-LED_G4 = LED: Value: JNJ-LEHG0113W120
R2 = R: Value: R30
U5 = AL8862SP-13: MPN: AL8862SP-13; Value: AL8862SP-13

## Sheet led_cc_driver_ir.SchDoc
size 297 x 209 mm
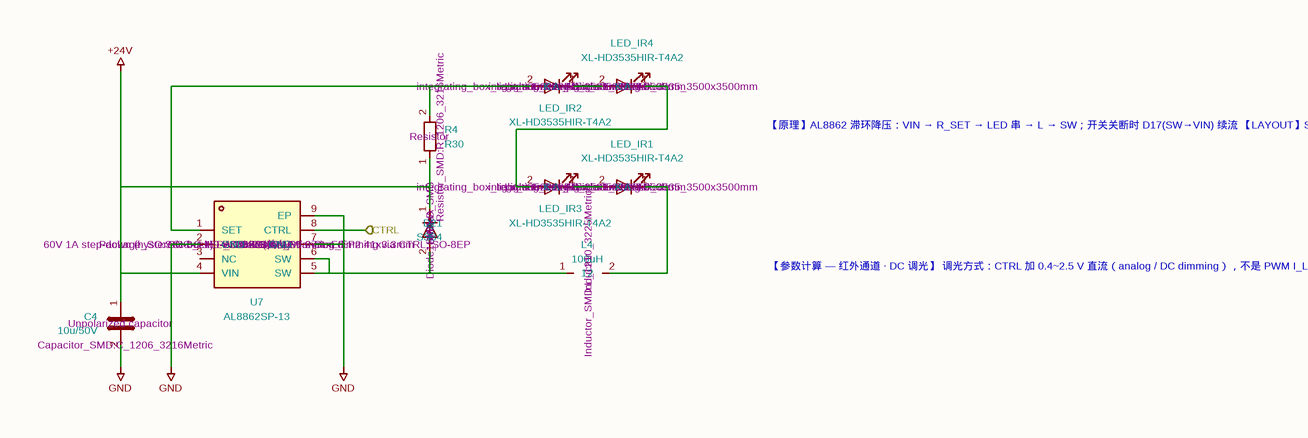
[diagram p6: led_cc_driver_ir.SchDoc]

### Parts
C4  Description: Unpolarized capacitor  Footprint: Capacitor_SMD:C_1206_3216Metric  [C_1206_3216Metric]  (hidden comment: 10u/50V)
D21  Description: Diode  Sim.Pins: 1=K 2=A  Footprint: Diode_SMD:D_SMB  [D_SMB]  (hidden comment: SS34)
L4  Description: Inductor  Footprint: Inductor_SMD:L_1210_3225Metric  [L_1210_3225Metric]  (hidden comment: 100uH)
LED_IR1  Description: Light emitting diode  Sim.Pins: 1=K 2=A  LCSC Part: C5221244  Footprint: integrating_box_light_source:LED_3535_3500x3500mm  [LED_3535_3500x3500mm]  (hidden comment: XL-HD3535HIR-T4A2)
LED_IR2  Description: Light emitting diode  Sim.Pins: 1=K 2=A  LCSC Part: C5221244  Footprint: integrating_box_light_source:LED_3535_3500x3500mm  [LED_3535_3500x3500mm]  (hidden comment: XL-HD3535HIR-T4A2)
LED_IR3  Description: Light emitting diode  Sim.Pins: 1=K 2=A  LCSC Part: C5221244  Footprint: integrating_box_light_source:LED_3535_3500x3500mm  [LED_3535_3500x3500mm]  (hidden comment: XL-HD3535HIR-T4A2)
LED_IR4  Description: Light emitting diode  Sim.Pins: 1=K 2=A  LCSC Part: C5221244  Footprint: integrating_box_light_source:LED_3535_3500x3500mm  [LED_3535_3500x3500mm]  (hidden comment: XL-HD3535HIR-T4A2)
R4  Description: Resistor  Footprint: Resistor_SMD:R_1206_3216Metric  [R_1206_3216Metric]  (hidden comment: R30)
U7  Description: 60V 1A step-down (hysteretic buck) LED driver, PWM/analog dimming via CTRL, SO-8EP  LCSC Part: C526360  Manufacturer: DIODES(美台)  Package: SO-8_L4.9-W3.9-P1.27-LS6.0-BL-EP  Footprint: Package_SO:SOIC-8-1EP_3.9x4.9mm_P1.27mm_EP2.41x3.3mm  [SOIC-8-1EP_3.9x4.9mm_P1.27mm_EP2.41x3.3mm]  (hidden comment: AL8862SP-13)

### Ports
CTRL (in)

### Nets
+24V: C4.1 D21.1(K) R4.1 U7.4(VIN)
GND: C4.2 U7.2(GND) U7.7(GND) U7.9(EP)
CH4: U7.8(CTRL) ; port CTRL
NetD21_2: D21.2(A) L4.1 U7.5(SW) U7.6(SW)
NetL4_2: L4.2 LED_IR1.1(K)
NetLED_IR1_2: LED_IR1.2(A) LED_IR3.1(K)
NetLED_IR2_1: LED_IR2.1(K) LED_IR4.2(A)
NetLED_IR2_2: LED_IR2.2(A) R4.2 U7.1(SET)
NetLED_IR3_2: LED_IR3.2(A) LED_IR4.1(K)

Not connected (* = marked no-connect by the designer): U7 3(NC)

### Notes on the sheet
- 【原理】AL8862 滞环降压：VIN → R_SET → LED 串 → L → SW；开关关断时 D17(SW→VIN) 续流
  【LAYOUT】SW→L/D 走线最短以降低 EMI；EP 大面积铺铜 + 散热过孔；R_SET 与 VIN/SET 用 Kelvin 接法
  【焊接】3535 灯珠回流焊 240±5℃/6s，只建议返修时手工焊（<300℃/3s）
- 【参数计算 — 红外通道 · DC 调光】
  调光方式：CTRL 加 0.4~2.5 V 直流（analog / DC dimming），不是 PWM
  I_LED(100%) = 0.1/0.30 = 333 mA；ΔI = 26 mV/R_SET = 86.6 mA（VSET_HYS = ±13%，固定值）
  V_LED = 4×1.55 V = 6.2 V
  t_OFF = 100µ×86.6m/(6.2+0.5+0.13) = 1268 ns
  t_ON = 8.66µ/(24−6.2−0.13) = 487 ns → f_SW = 570 kHz（满载 CCM）
  红外灯珠 Vf 温漂较大（约 −3 mV/K）：低温时 V_LED 略升，仍远低于 24 V 母线
- 1
- 2
- 3
- 4
- 5
- 6
- A
- B
- C
- 通道：红外 850nm / 4 颗 3535 串联
- IC：AL8862SP-13 (LCSC C526360)
- 灯珠：XL-HD3535HIR-T4A2 (LCSC C5221244)
- D
- Title: LED 恒流驱动 — 红外通道
- File: led_cc_driver_ir.kicad_sch
- Sheet: /
- integrating_box_light_source
- KiCad E.D.A.  kicad (5.1.4)-1
- Size: A4
- Date: 2026-11-08
- Rev: A
- Id: 1/1

### Library data of the parts
C4 = C: Value: 10u/50V
D21 = D: Sim.Device: D; Value: SS34
L4 = L: Value: 100uH
LED_IR1-LED_IR4 = LED: Value: XL-HD3535HIR-T4A2
R4 = R: Value: R30
U7 = AL8862SP-13: MPN: AL8862SP-13; Value: AL8862SP-13

## Sheet led_cc_driver.SchDoc
size 297 x 209 mm
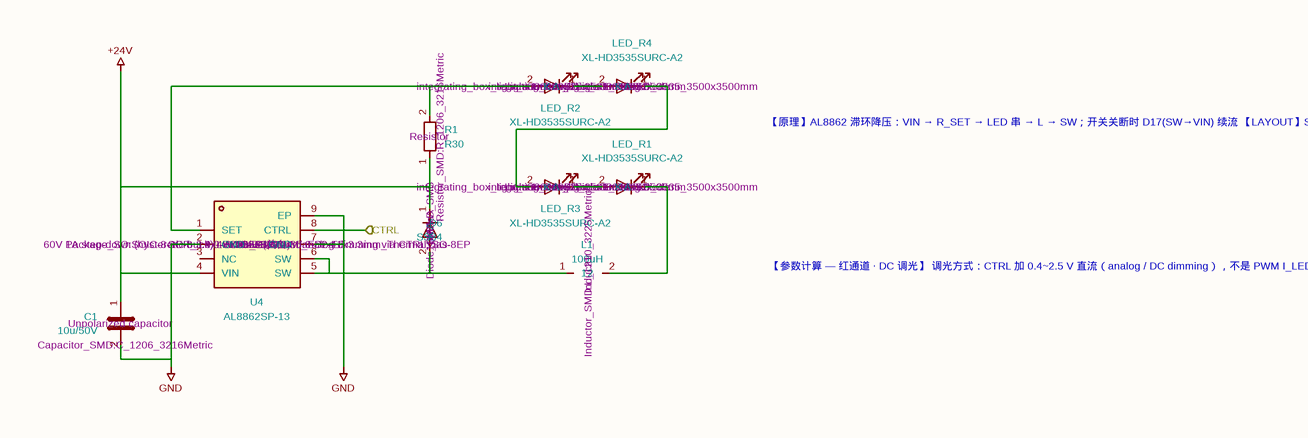
[diagram p7: led_cc_driver.SchDoc]

### Parts
C1  Description: Unpolarized capacitor  Footprint: Capacitor_SMD:C_1206_3216Metric  [C_1206_3216Metric]  (hidden comment: 10u/50V)
D6  Description: Diode  Sim.Pins: 1=K 2=A  Footprint: Diode_SMD:D_SMB  [D_SMB]  (hidden comment: SS34)
L1  Description: Inductor  Footprint: Inductor_SMD:L_1210_3225Metric  [L_1210_3225Metric]  (hidden comment: 100uH)
LED_R1  Description: Light emitting diode  Sim.Pins: 1=K 2=A  LCSC Part: C3646952  Footprint: integrating_box_light_source:LED_3535_3500x3500mm  [LED_3535_3500x3500mm]  (hidden comment: XL-HD3535SURC-A2)
LED_R2  Description: Light emitting diode  Sim.Pins: 1=K 2=A  LCSC Part: C3646952  Footprint: integrating_box_light_source:LED_3535_3500x3500mm  [LED_3535_3500x3500mm]  (hidden comment: XL-HD3535SURC-A2)
LED_R3  Description: Light emitting diode  Sim.Pins: 1=K 2=A  LCSC Part: C3646952  Footprint: integrating_box_light_source:LED_3535_3500x3500mm  [LED_3535_3500x3500mm]  (hidden comment: XL-HD3535SURC-A2)
LED_R4  Description: Light emitting diode  Sim.Pins: 1=K 2=A  LCSC Part: C3646952  Footprint: integrating_box_light_source:LED_3535_3500x3500mm  [LED_3535_3500x3500mm]  (hidden comment: XL-HD3535SURC-A2)
R1  Description: Resistor  Footprint: Resistor_SMD:R_1206_3216Metric  [R_1206_3216Metric]  (hidden comment: R30)
U4  Description: 60V 1A step-down (hysteretic buck) LED driver, PWM/analog dimming via CTRL, SO-8EP  LCSC Part: C526360  Manufacturer: DIODES(美台)  Package: SO-8_L4.9-W3.9-P1.27-LS6.0-BL-EP  Footprint: Package_SO:SOIC-8-1EP_3.9x4.9mm_P1.27mm_EP2.41x3.3mm_ThermalVias  [SOIC-8-1EP_3.9x4.9mm_P1.27mm_EP2.41x3.3mm_ThermalVias]  (hidden comment: AL8862SP-13)

### Ports
CTRL (in)

### Nets
+24V: C1.1 D6.1(K) R1.1 U4.4(VIN)
GND: C1.2 U4.2(GND) U4.7(GND) U4.9(EP)
CH1: U4.8(CTRL) ; port CTRL
NetD6_2: D6.2(A) L1.1 U4.5(SW) U4.6(SW)
NetL1_2: L1.2 LED_R1.1(K)
NetLED_R1_2: LED_R1.2(A) LED_R3.1(K)
NetLED_R2_1: LED_R2.1(K) LED_R4.2(A)
NetLED_R2_2: LED_R2.2(A) R1.2 U4.1(SET)
NetLED_R3_2: LED_R3.2(A) LED_R4.1(K)

Not connected (* = marked no-connect by the designer): U4 3(NC)

### Notes on the sheet
- 【原理】AL8862 滞环降压：VIN → R_SET → LED 串 → L → SW；开关关断时 D17(SW→VIN) 续流
  【LAYOUT】SW→L/D 走线最短以降低 EMI；EP 大面积铺铜 + 散热过孔；R_SET 与 VIN/SET 用 Kelvin 接法
  【焊接】3535 灯珠回流焊 240±5℃/6s，只建议返修时手工焊（<300℃/3s）
- 【参数计算 — 红通道 · DC 调光】
  调光方式：CTRL 加 0.4~2.5 V 直流（analog / DC dimming），不是 PWM
  I_LED(100%) = 0.1/R_SET = 0.1/0.30 = 333 mA（V_SET 典型 100 mV）
  ΔI = 26 mV/R_SET = 86.6 mA —— 固定值（手册 VSET_HYS = ±13% × 100 mV），调暗时纹波不跟着变小
  V_LED = 4×2.4 V = 9.6 V
  t_OFF = L·ΔI/(V_LED+V_D+I_LED·(R_SET+R_L)) = 100µ×86.6m/10.1 = 857 ns
  t_ON = L·ΔI/(V_IN−V_LED−I_LED·(R_SET+R_L+R_SW)) = 8.66µ/13.6 = 613 ns
  f_SW = 1/(t_ON+t_OFF) = 680 kHz（满载 CCM；调暗到 10% 时 I_avg < ΔI/2 → 进 DCM，频率下降）
  P_R_SET = I²R = 0.033 W；C6 ≥ I(1−D)/(f·ΔV) = 2.9 µF → 10 µF/50V
- 1
- 2
- 3
- 4
- 5
- 6
- A
- B
- C
- 通道：红光 625nm / 4 颗 3535 串联
- IC：AL8862SP-13 (LCSC C526360)，滞环降压恒流
- 灯珠：XL-HD3535SURC-A2 (LCSC C3646952)
- D
- Title: LED 恒流驱动 — 红光通道
- File: led_cc_driver.kicad_sch
- Sheet: /
- integrating_box_light_source
- KiCad E.D.A.  kicad (5.1.4)-1
- Size: A4
- Date: 2026-11-08
- Rev: A
- Id: 1/1

### Library data of the parts
C1 = C: Value: 10u/50V
D6 = D: Sim.Device: D; Value: SS34
L1 = L: Value: 100uH
LED_R1-LED_R4 = LED: Value: XL-HD3535SURC-A2
R1 = R: Value: R30
U4 = AL8862SP-13: MPN: AL8862SP-13; Value: AL8862SP-13

## Nets that join several sheets
+3V3: integrating_box_light_source (5 pins), dac_with_external_vref (C12.1 C13.1 U3.1), power_protection (5 pins), light_sensor (C15.1 C16.1 U1.5 U2.5)
+24V: led_cc_driver_b (C3.1 D16.1 R3.1 U6.4), power_protection (6 pins), led_cc_driver_g (C2.1 D11.1 R2.1 U5.4), led_cc_driver_ir (C4.1 D21.1 R4.1 U7.4), led_cc_driver (C1.1 D6.1 R1.1 U4.4)
GND: integrating_box_light_source (5 pins), led_cc_driver_b (C3.2 U6.2 U6.7 U6.9), dac_with_external_vref (C12.2 C13.2 U3.4 U3.10), power_protection (9 pins), light_sensor (7 pins), led_cc_driver_g (C2.2 U5.2 U5.7 U5.9), led_cc_driver_ir (C4.2 U7.2 U7.7 U7.9), led_cc_driver (C1.2 U4.2 U4.7 U4.9)
VCOM: integrating_box_light_source (J1.1), power_protection (#FLG03.1 F1.1)
CH1: integrating_box_light_source (JP1.1 TP1.1), led_cc_driver (U4.8)
CH1: integrating_box_light_source (JP1.2), dac_with_external_vref (U3.6)
CH2: integrating_box_light_source (JP2.1 TP2.1), led_cc_driver_g (U5.8)
CH2: integrating_box_light_source (JP2.2), dac_with_external_vref (U3.7)
CH3: integrating_box_light_source (JP3.1 TP3.1), led_cc_driver_b (U6.8)
CH3: integrating_box_light_source (JP3.2), dac_with_external_vref (U3.8)
CH4: integrating_box_light_source (JP4.1 TP4.1), led_cc_driver_ir (U7.8)
CH4: integrating_box_light_source (JP4.2), dac_with_external_vref (U3.9)
SCL: integrating_box_light_source (J2.2 J4.3 R10.2), dac_with_external_vref (U3.2)
SCL: integrating_box_light_source (J3.2), light_sensor (U1.3)
SDA: integrating_box_light_source (J2.1 J4.2 R9.2), dac_with_external_vref (U3.3)
SDA: integrating_box_light_source (J3.3), light_sensor (U1.4)